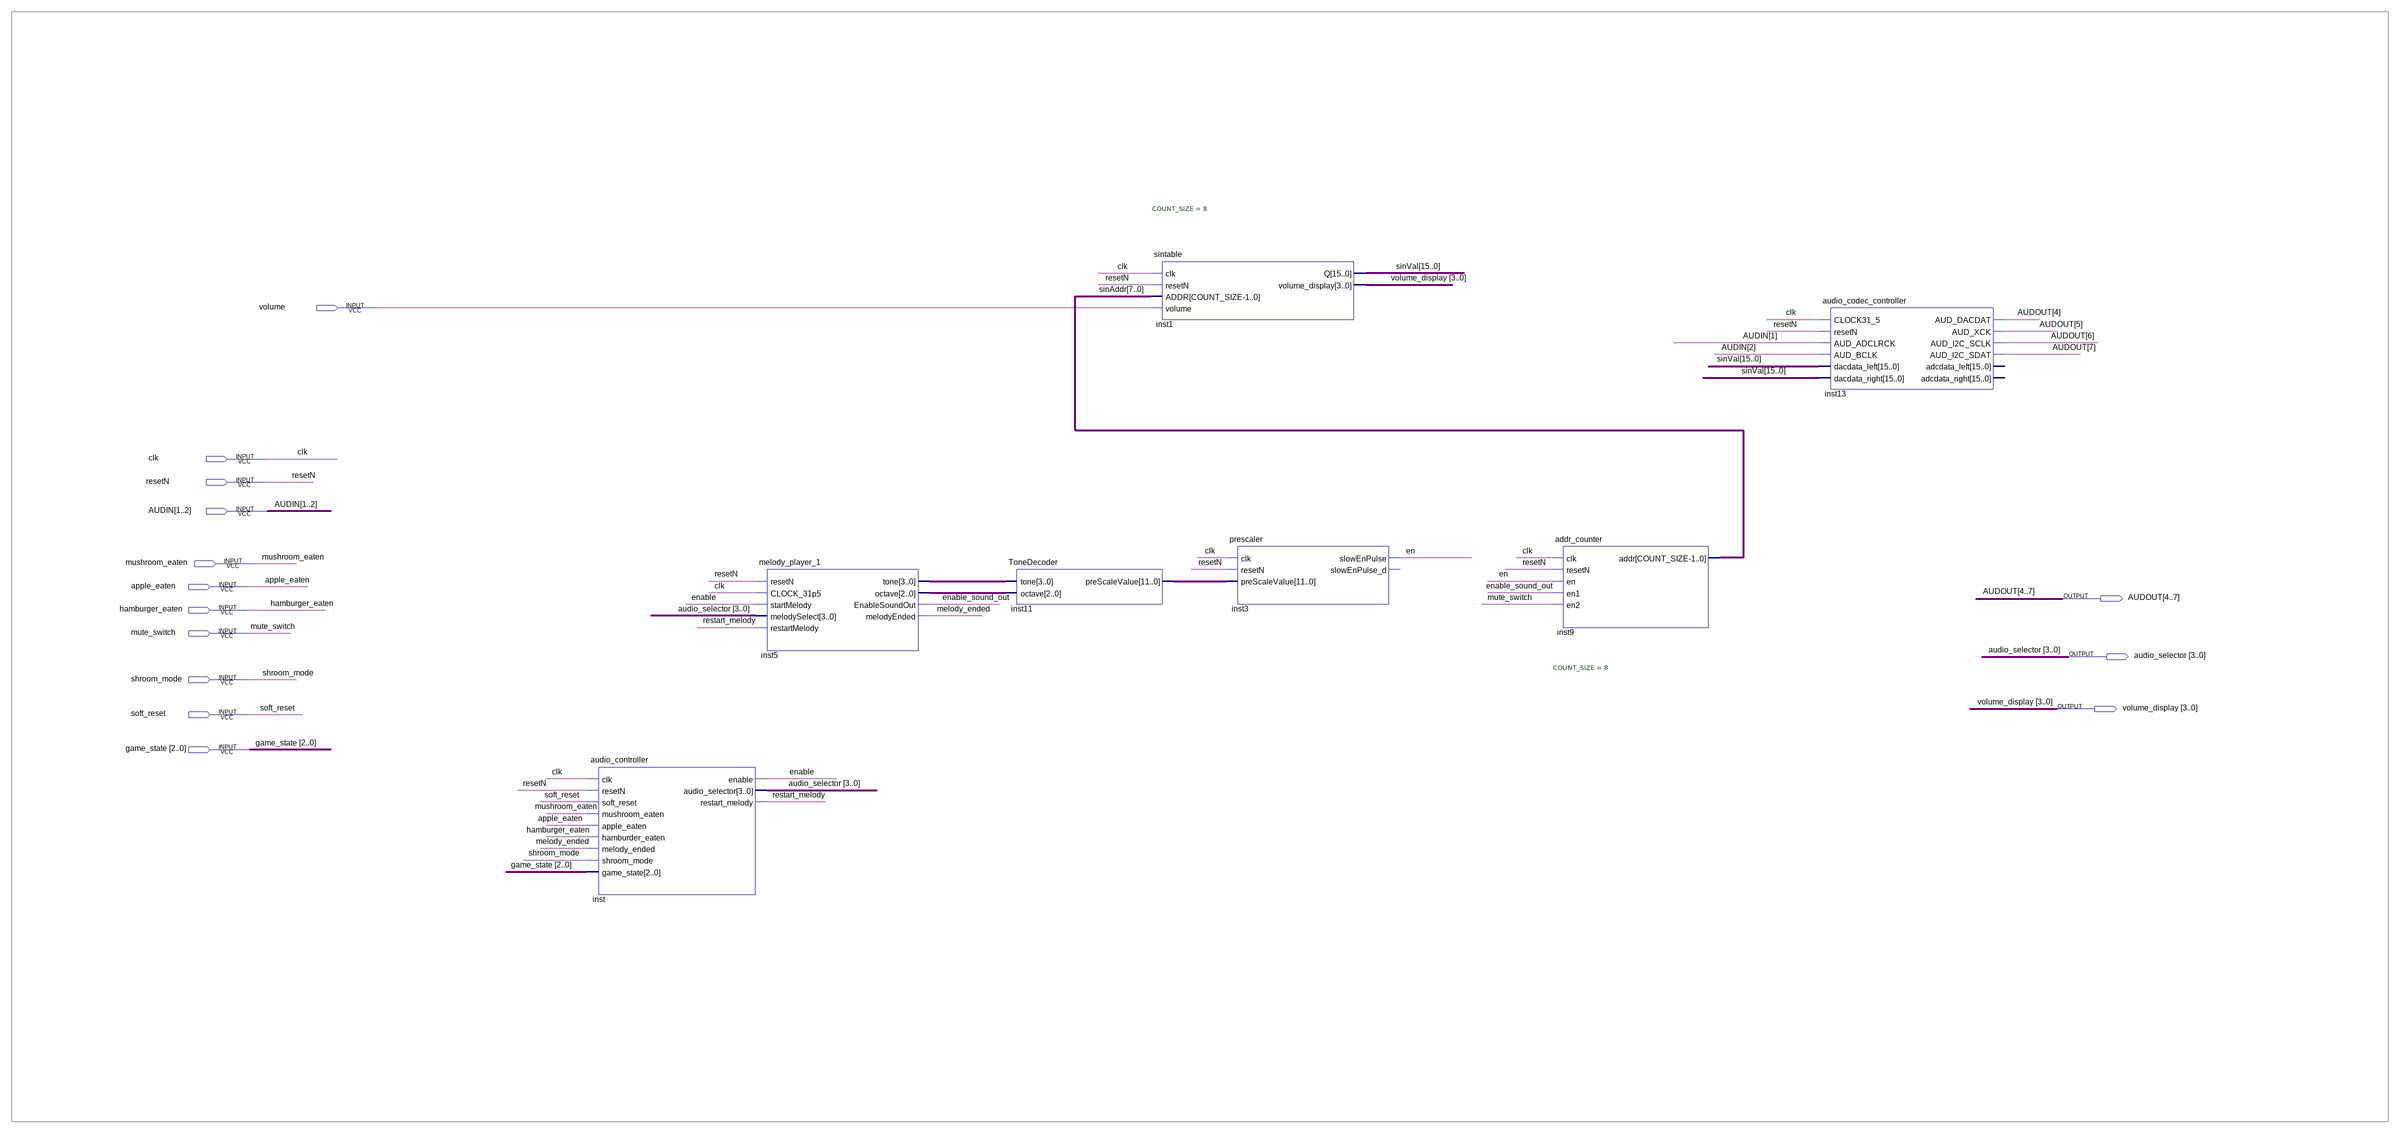
[diagram p0: schematic sheet]
// Quartus schematic AUDIO.bdf as structural Verilog: 7 symbols, 14 pins
module AUDIO (
  input  volume,
  input  clk,
  input  resetN,
  input  [1:2] AUDIN,
  input  mushroom_eaten,
  input  apple_eaten,
  input  hamburger_eaten,
  input  mute_switch,
  input  shroom_mode,
  input  soft_reset,
  input  [2:0] game_state,
  output [4:7] AUDOUT,
  output [3:0] audio_selector,
  output [3:0] volume_display
);

  wire en, enable, enable_sound_out, melody_ended, restart_melody;
  wire [2:0] inst5_octave;
  wire [3:0] inst5_tone;
  wire [7:0] sinAddr;
  wire [11:0] inst11_prescalevalue;
  wire [15:0] sinVal;

  audio_controller inst (
    .clk(clk), .resetN(resetN), .soft_reset(soft_reset), .mushroom_eaten(mushroom_eaten),
    .apple_eaten(apple_eaten), .hamburder_eaten(hamburger_eaten), .melody_ended(melody_ended),
    .shroom_mode(shroom_mode), .game_state(game_state), .enable(enable), .audio_selector(audio_selector),
    .restart_melody(restart_melody));
  melody_player_1 inst5 (
    .resetN(resetN), .CLOCK_31p5(clk), .startMelody(enable), .melodySelect(audio_selector),
    .restartMelody(restart_melody), .tone(inst5_tone), .octave(inst5_octave),
    .EnableSoundOut(enable_sound_out), .melodyEnded(melody_ended));
  ToneDecoder inst11 (.tone(inst5_tone), .octave(inst5_octave), .preScaleValue(inst11_prescalevalue));
  sintable #(.COUNT_SIZE(8)) inst1 (
    .clk(clk), .resetN(resetN), .ADDR(sinAddr), .volume(volume), .Q(sinVal), .volume_display(volume_display));
  prescaler inst3 (
    .clk(clk), .resetN(resetN), .preScaleValue(inst11_prescalevalue), .slowEnPulse(en));  // open: slowEnPulse_d
  addr_counter #(.COUNT_SIZE(8)) inst9 (
    .clk(clk), .resetN(resetN), .en(en), .en1(enable_sound_out), .en2(mute_switch), .addr(sinAddr));
  audio_codec_controller inst13 (
    .CLOCK31_5(clk), .resetN(resetN), .AUD_ADCLRCK(AUDIN[1]), .AUD_BCLK(AUDIN[2]), .dacdata_left(sinVal),
    .dacdata_right(sinVal), .AUD_DACDAT(AUDOUT[4]), .AUD_XCK(AUDOUT[5]), .AUD_I2C_SCLK(AUDOUT[6]),
    .AUD_I2C_SDAT(AUDOUT[7]));  // open: adcdata_left, adcdata_right
endmodule
